# Altium schematic sheet Sheet1.SchDoc
size A4; SheetNumber: 1; SheetTotal: 6
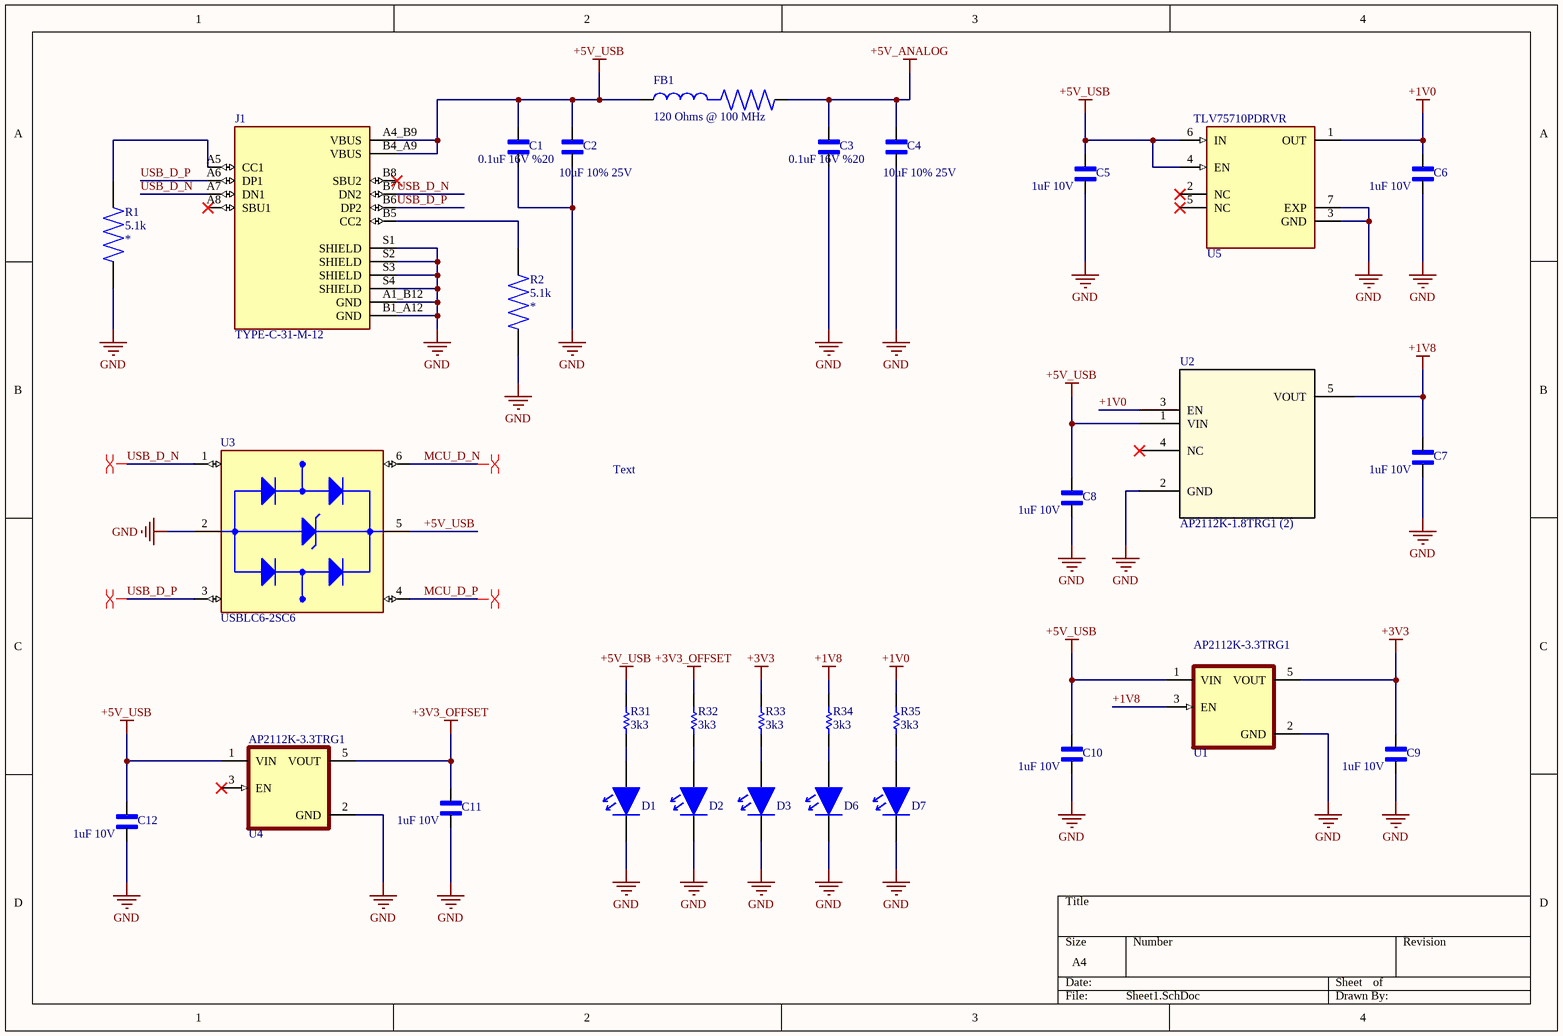
[diagram p0: Sheet1.SchDoc]

## Parts
C1  Parameter 1: 0.1uF 16V %20  [0402]  (hidden comment: 0402YC104MAT2A)
C2  Parameter 1: 10uF 10% 25V  [0603]  (hidden comment: GRM21BZ71E106KE15L)
C3  Parameter 1: 0.1uF 16V %20  [0402]  (hidden comment: 0402YC104MAT2A)
C4  Parameter 1: 10uF 10% 25V  [0603]  (hidden comment: GRM21BZ71E106KE15L)
C5  Parameter 1: 1uF 10V  [0603]  (hidden comment: CAP_CER_0603)
C6  Parameter 1: 1uF 10V  [0603]  (hidden comment: CAP_CER_0603)
C7  Parameter 1: 1uF 10V  [0603]  (hidden comment: CAP_CER_0603)
C8  Parameter 1: 1uF 10V  [0603]  (hidden comment: CAP_CER_0603)
C9  Parameter 1: 1uF 10V  [0603]  (hidden comment: CAP_CER_0603)
C10  Parameter 1: 1uF 10V  [0603]  (hidden comment: CAP_CER_0603)
C11  Parameter 1: 1uF 10V  [0603]  (hidden comment: CAP_CER_0603)
C12  Parameter 1: 1uF 10V  [0603]  (hidden comment: CAP_CER_0603)
D1  LTST-C171GKT  [LED_GREEN_0805]  (value not drawn)
D2  LTST-C171GKT  [LED_GREEN_0805]  (value not drawn)
D3  LTST-C171GKT  [LED_GREEN_0805]  (value not drawn)
D6  LTST-C171GKT  [LED_GREEN_0805]  (value not drawn)
D7  LTST-C171GKT  [LED_GREEN_0805]  (value not drawn)
FB1  Parameter 1: 120 Ohms @ 100 MHz  [0603_FB]  (hidden comment: BLM18PG121SN1D)
J1  TYPE-C-31-M-12  [HRO_TYPE-C-31-M-12]
R1  5.1k  [0603]
R2  5.1k  [0603]
R31  3k3  [RESC1005X40X20NL05T10]
R32  3k3  [RESC1005X40X20NL05T10]
R33  3k3  [RESC1005X40X20NL05T10]
R34  3k3  [RESC1005X40X20NL05T10]
R35  3k3  [RESC1005X40X20NL05T10]
U1  AP2112K-3.3TRG1  [SOT-25]
U2  AP2112K-1.8TRG1 (2)  [AP2112K-1.8TRG1_DIO]
U3  USBLC6-2SC6  [SOT95P280X145-6N]
U4  AP2112K-3.3TRG1  [SOT-25]
U5  TLV75710PDRVR  [WSON-6]

## Nets
+1V0: C6.2 R35.2 U2.3(EN) U5.1(OUT)
+1V8: C7.2 R34.2 U1.3(EN) U2.5(VOUT)
+3V3: C9.2 R33.2 U1.5(VOUT)
+3V3_OFFSET: C11.2 R32.2 U4.5(VOUT)
+5V_ANALOG: C3.2 C4.2 FB1.2
+5V_USB: C1.2 C2.2 C5.2 C8.2 C10.2 C12.2 FB1.1 J1.A4_B9(VBUS) J1.B4_A9(VBUS) R31.2 U1.1(VIN) U2.1(VIN) U3.5(VBUS) U4.1(VIN) U5.4(EN) U5.6(IN)
GND: C1.1 C2.1 C3.1 C4.1 C5.1 C6.1 C7.1 C8.1 C9.1 C10.1 C11.1 C12.1 D1.1 D2.1 D3.1 D6.1 D7.1 J1.A1_B12(GND) J1.B1_A12(GND) J1.S1(SHIELD) J1.S2(SHIELD) J1.S3(SHIELD) J1.S4(SHIELD) R1.1 R2.1 U1.2(GND) U2.2(GND) U3.2(GND) U4.2(GND) U5.3(GND) U5.7(EXP)
MCU_D_N: U3.6(I/O1_OUT)
MCU_D_P: U3.4(I/O2_OUT)
USB_D_N: J1.A7(DN1) J1.B7(DN2) U3.1(I/O1_IN)
USB_D_P: J1.A6(DP1) J1.B6(DP2) U3.3(I/O2_IN)
NetD1_2: D1.2 R31.1
NetD2_2: D2.2 R32.1
NetD3_2: D3.2 R33.1
NetD6_2: D6.2 R34.1
NetD7_2: D7.2 R35.1
NetJ1_A5: J1.A5(CC1) R1.2
NetJ1_B5: J1.B5(CC2) R2.2

Not connected (* = marked no-connect by the designer): J1 A8(SBU1)* B8(SBU2)*; U2 4(NC)*; U4 3(EN)*; U5 2(NC)* 5(NC)*

## Layout directives
differential pair: MCU_D_N, MCU_D_P, USB_D_N, USB_D_P

## Notes on the sheet
- Text

## Library data of the parts
C1 C3 = CAP_CER_0402: 0.1 µF ±20% 16V Ceramic Capacitor X7R 0402 (1005 Metric)
C2 C4 = GRM21BZ71E106KE15L: SMD capacitor X7R(MURATA) with capacitance 10uF Tol.10%. Rated voltage 25Vdc 125C
C5-C12 = CAP_CER_0603: CAP CER 1UF 10V X7R 0603 / AC0603KRX7R6BB105
D1-D3 D6 D7 = LED GREEN 0805: Green 0805 130 º Min 5 mcd Typical 12 mcd Water Clear Lens SMT LED; Manufacturer: Vishay Lite-On; Designed by: BERK; Lens Color: Colorless; Viewing Angle: 130°; Lens Style: Diffused,Colorless,Rectangular,Clear; Luminous Intensity: 12mcd; Forward Current: 30mA; Forward Voltage: 2.1V; Power Rating: 100mW; Dominant Wavelength: 569nm; Test Current: 10mA; Number of Elements: 1; Wavelength: 585nm; Reverse Voltage: 5V; Supplier 1: Digi-Key; Manufacturer Part Number: LTST-C171GKT; RoHS: Yes; Category: LEDs; Stock 1: 159023; Pricing 1: 1=0,26000, 10=0,14100, 100=0,06560, 500=0,06060, 1000=0,04747 (USD); Mount: Surface Mount; Case/Package: 0805; Number of Pins: 2; Color: Green; Case Code (Metric): 2012; Case Code (Imperial): 0805; Min Operating Temperature: -55°C; Max Operating Temperature: 85°C; Package Quantity: 1; Packaging: Tape and Reel; Illumination Color: Green; Lens Transparency: Clear; Power Dissipation: 100mW; Number of LEDs: 1; Series: CHIPLED 0805; Length: 2mm; Width: 1.25mm; Height: 0.8mm; Depth: 1.25mm; Radiation Hardening: No; Lead Free: Lead Free; RoHS Compliant: Yes; ComponentLink1URL: https://datasheet.ciiva.com/2110/ltst-c171gkt-2110000.pdf?src-supplier=Digi-Key; ComponentLink1Description: https://datasheet.ciiva.com/2110/ltst-c171gkt-2110000.pdf?src-supplier=Digi-Key; ComponentLink2URL: https://datasheet.ciiva.com/11773/0900766b80dc0296-11773991.pdf?src-supplier=RSComponents; ComponentLink2Description: https://datasheet.ciiva.com/11773/0900766b80dc0296-11773991.pdf?src-supplier=RSComponents; ComponentLink3URL: https://datasheet.ciiva.com/12400/lite-on-ltst-c171gkt-190133-12400647.pdf?src-supplier=Mouser; ComponentLink3Description: https://datasheet.ciiva.com/12400/lite-on-ltst-c171gkt-190133-12400647.pdf?src-supplier=Mouser; ComponentLink4URL: https://datasheet.ciiva.com/2110/ltst-c171gkt-2110001.pdf?src-supplier=Digi-Key; ComponentLink4Description: https://datasheet.ciiva.com/2110/ltst-c171gkt-2110001.pdf?src-supplier=Digi-Key; ComponentLink5URL: https://datasheet.ciiva.com/2110/ltst-c171gkt-2110002.pdf?src-supplier=Digi-Key; ComponentLink5Description: https://datasheet.ciiva.com/2110/ltst-c171gkt-2110002.pdf?src-supplier=Digi-Key; ComponentLink6URL: https://datasheet.ciiva.com/16396/ltst-c171gkt-16396549.pdf?src-supplier=Future+Electronics; ComponentLink6Description: https://datasheet.ciiva.com/16396/ltst-c171gkt-16396549.pdf?src-supplier=Future+Electronics; Supplier Part Number 1: 160-1423-1-ND
FB1 = BLM18PG121SN1D: 120 Ohms @ 100 MHz 1 Power Line Ferrite Bead 0603 (1608 Metric) 2A 50mOhm
J1 = TYPE-C-31-M-12: USB Connectors 24 Receptacle 1 8.94*7.3mm RoHS; MF: HRO Electronics Co., Ltd.; SnapEDA_Link: https://www.snapeda.com/parts/TYPE-C-31-M-12/HRO+Electronics+Co.%252C+Ltd./view-part/?ref=snap; Package: Package; Value: *; MP: TYPE-C-31-M-12; Check_prices: https://www.snapeda.com/parts/TYPE-C-31-M-12/HRO+Electronics+Co.%252C+Ltd./view-part/?ref=eda
R1 R2 = RES_0603: Parameter 1: *
R31-R35 = CMP-2002-01682-1: Manufacturer: Vishay BCcomponents; Part Number: TNPW040210K0DEED
U1 U4 = AP2112K-3.3TRG1: Linear Voltage Regulator IC Positive Fixed 1 Output 600mA SOT-25
U2 = AP2112K-1.8TRG1 (2): AP2112 Series 1.8 V 600 mA Fixed Output SMT Voltage Regulator - SOT-23-5; Manufacturer: Diodes Inc.; Accuracy: 1.5%; Dropout Voltage: 500mV; Max Supply Voltage: 6V; Max Junction Temperature (Tj): 85°C; Max Output current: 600mA; Min Input Voltage: 2.5V; Number of Channels: 1; Output Voltage: 1.8V; Polarity: Positive; Quiescent Current: 80µA; Supplier: Arrow Electronics; Supplier Part Number: AP2112K-1.8TRG1; Manufacturer Part Number: AP2112K-1.8TRG1; RoHS: Compliant; Category: LDO Voltage Regulators; Stock: 5067; Pricing: 1=0,0897, 10=0,0624, 25=0,0577 (USD); Case/Package: LSSOP; China RoHS: Compliant; Export Control Classification Number (ECCN) Code: EAR99; Height: 1.3mm; Height - Seated (Max): 1.45mm; Harmonized Tariff Schedule (HTS) Code: 8542.39.00.60; Length: 2.92mm; Lifecycle Status: Production; Max Operating Temperature: 85°C; Min Operating Temperature: -40°C; Mounting Technology: Surface Mount; Number of Circuits: 1; Number of Outputs: 1; Pins: 5; Number of Regulators: 1; Number of Terminals: 5; Output Current: 600mA; Output Type: Fixed; Packaging: Tape & Reel (TR); REACH SVHC: Yes; Schedule B: 8542390000, 8542390000|8542390000, 8542390000|8542390000|8542390000, 8542390000|8542390000|8542390000|8542390000; Terminal Pitch: 950µm; Voltage Tolerance: 1.5%; Width: 1.6mm; ComponentLink1URL: https://datasheet.octopart.com:443/AP2112K-1.8TRG1-Diodes-Inc.-datasheet-101745658.pdf?src-supplier=IHS; ComponentLink1Description: https://datasheet.octopart.com:443/AP2112K-1.8TRG1-Diodes-Inc.-datasheet-101745658.pdf?src-supplier=IHS; ComponentLink2URL: https://datasheet.octopart.com:443/AP2112K-1.8TRG1-Diodes-Inc.-datasheet-182385097.pdf?src-supplier=IHS; ComponentLink2Description: https://datasheet.octopart.com:443/AP2112K-1.8TRG1-Diodes-Inc.-datasheet-182385097.pdf?src-supplier=IHS; ComponentLink3URL: https://datasheet.octopart.com:443/AP2112K-1.8TRG1-Diodes-Inc.-datasheet-37177583.pdf?src-supplier=SHENGYU+ELECTRONICS; ComponentLink3Description: https://datasheet.octopart.com:443/AP2112K-1.8TRG1-Diodes-Inc.-datasheet-37177583.pdf?src-supplier=SHENGYU+ELECTRONICS
U3 = USBLC6-2SC6: 17V Clamp 5A (8/20Âµs) Ipp Tvs Diode Surface Mount SOT-23-6; MF: STMicroelectronics; Value: *; SnapEDA_Link: https://www.snapeda.com/parts/USBLC6-2SC6/STMicroelectronics/view-part/?ref=snap; Check_prices: https://www.snapeda.com/parts/USBLC6-2SC6/STMicroelectronics/view-part/?ref=eda; Purchase-URL: https://pricing.snapeda.com/search/part/USBLC6-2SC6/?ref=eda; Price: None; Availability: In Stock; Package: SOT-23-6 STMicroelectronics; MP: USBLC6-2SC6
U5 = TLV75710PDRVR: 1-A, low-IQ high-accuracy low-dropout (LDO) voltage regulator with enable